# Altium schematic sheet WIFI_Sheet.SchDoc (part 1 of 3)
size 420 x 297 mm; SheetNumber: 1; SheetTotal: 2
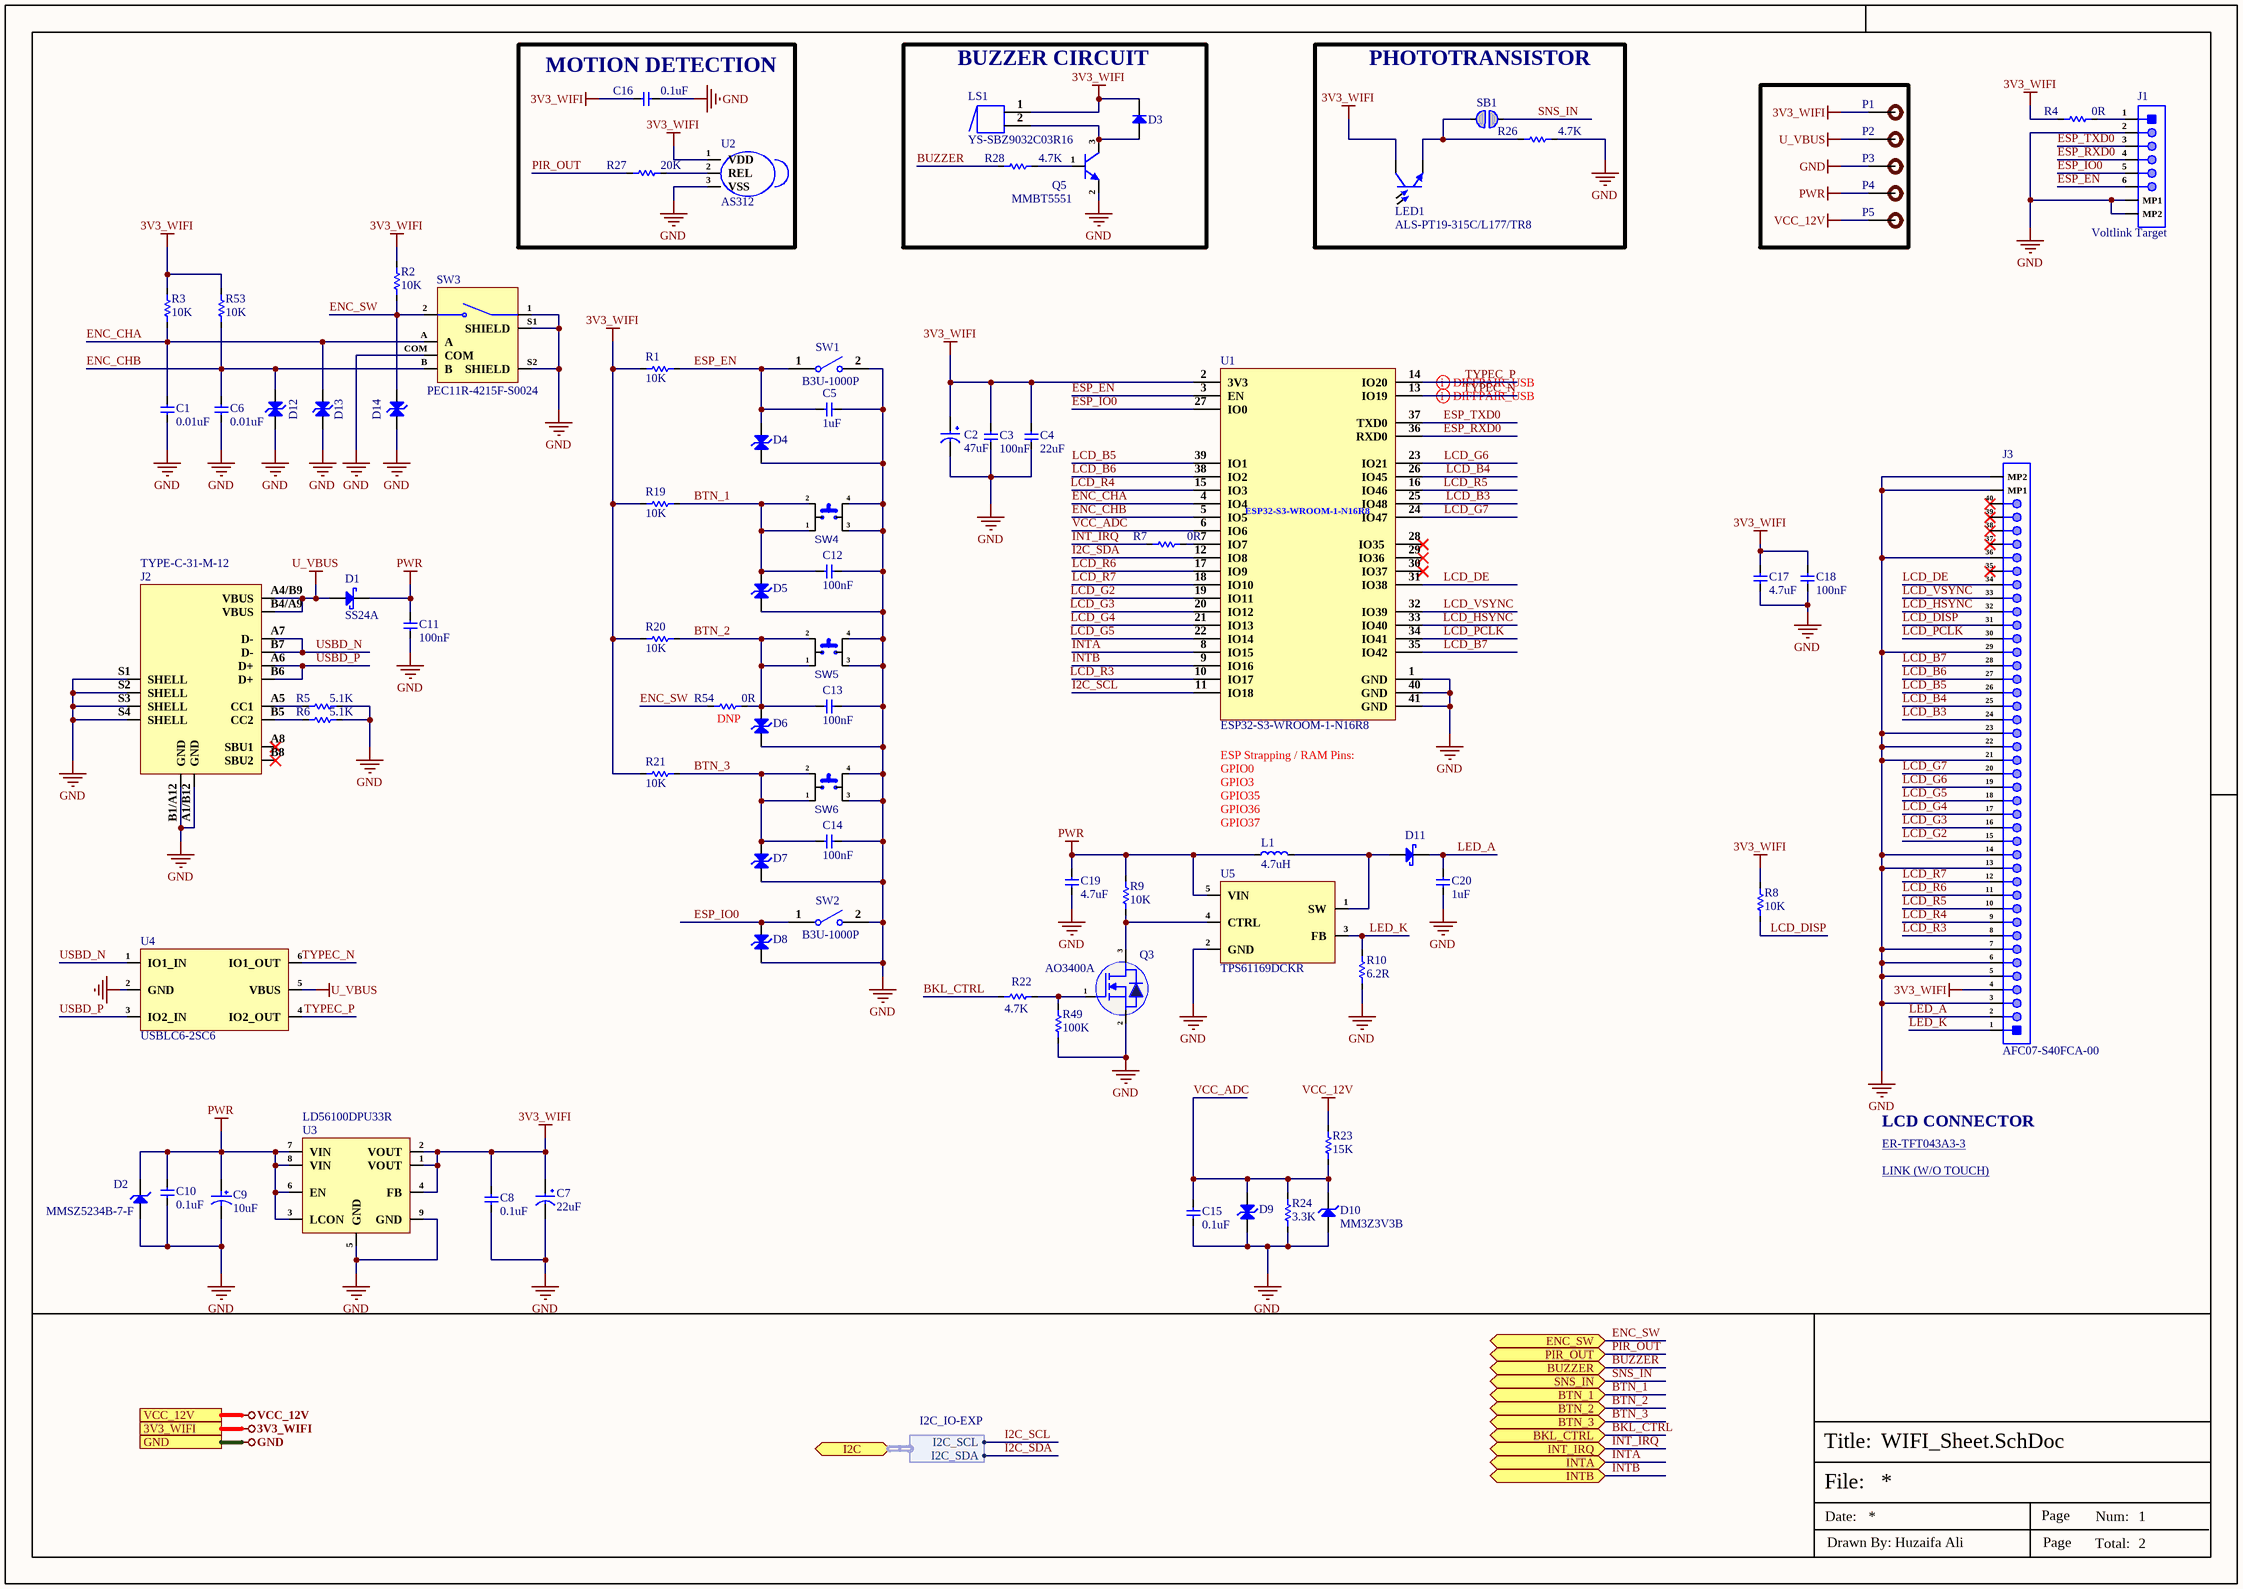
[diagram p0: WIFI_Sheet.SchDoc]

## Parts
C1  0.01uF  [Cap-0402]
C2  47uF  [Case-D]
C3  100nF  [Cap-0402]
C4  22uF  [Cap-0603]
C5  1uF  [Cap-0402]
C6  0.01uF  [Cap-0402]
C7  22uF  [Tant-0805]
C8  0.1uF  [Cap-0402]
C9  10uF  [Case-A]
C10  0.1uF  [Cap-0402]
C11  100nF  [Cap-0603]
C12  100nF  [Cap-0402]
C13  100nF  [Cap-0402]
C14  100nF  [Cap-0402]
C15  0.1uF  [Cap-0402]
C16  0.1uF  [Cap-0603]
C17  4.7uF  [Cap-0603]
C18  100nF  [Cap-0603]
C19  4.7uF  [Cap-0603]
C20  1uF  [Cap-0603]
D1  SS24A  [SMA]
D2  MMSZ5234B-7-F  [SOD-123]
D3  1N4148W-7-F  [SOD-123]  (value not drawn)
D4  LESD8D3.3CAT5G  [SOD-882 Bi Directional]  (value not drawn)
D5  LESD8D3.3CAT5G  [SOD-882 Bi Directional]  (value not drawn)
D6  LESD8D3.3CAT5G  [SOD-882 Bi Directional]  (value not drawn)
D7  LESD8D3.3CAT5G  [SOD-882 Bi Directional]  (value not drawn)
D8  LESD8D3.3CAT5G  [SOD-882 Bi Directional]  (value not drawn)
D9  LESD8D3.3CAT5G  [SOD-882 Bi Directional]  (value not drawn)
D10  MM3Z3V3B  [SOD323F]
D11  NSR0240HT1G  [SOD-323]  (value not drawn)
D12  LESD8D3.3CAT5G  [SOD-882 Bi Directional]  (value not drawn)
D13  LESD8D3.3CAT5G  [SOD-882 Bi Directional]  (value not drawn)
D14  LESD8D3.3CAT5G  [SOD-882 Bi Directional]  (value not drawn)
J1  Voltlink Target  [Voltlink Target]
J2  TYPE-C-31-M-12  [TYPE-C-31-M-12_]
J3  AFC07-S40FCA-00  [AFC07-S40FCA-00]
L1  4.7uH  [MWSA0402S-4R7MT]
LED1  ALS-PT19-315C/L177/TR8  [ALS-PT19-315C/L177/TR_]
LS1  YS-SBZ9032C03R16  [YS-SBZ9032C03R16_]
P1  TEST POINT 0.5mm Dia  [Test-point - 0.5mm]  (value not drawn)
P2  TEST POINT 0.5mm Dia  [Test-point - 0.5mm]  (value not drawn)
P3  TEST POINT 0.5mm Dia  [Test-point - 0.5mm]  (value not drawn)
P4  TEST POINT 0.5mm Dia  [Test-point - 0.5mm]  (value not drawn)
P5  TEST POINT 0.5mm Dia  [Test-point - 0.5mm]  (value not drawn)
Q3  AO3400A  [sot-23]
Q5  MMBT5551  [SOT-23]
R1  10K  [Res-0402]
R2  10K  [Res-0603]
R3  10K  [Res-0603]
R4  0R  [Res-0603]
R5  5.1K  [Res-0603]
R6  5.1K  [Res-0603]
R7  0R  [Res-0603]
R8  10K  [Res-0603]
R9  10K  [Res-0603]
R10  6.2R  [Res-1206]
R19  10K  [Res-0402]
R20  10K  [Res-0402]
R21  10K  [Res-0402]
R22  4.7K  [Res-0402]
R23  15K  [Res-0603]
R24  3.3K  [Res-0603]
R26  4.7K  [Res-0603]
R27  20K  [Res-0603]
R28  4.7K  [Res-0603]
R49  100K  [Res-0402]
R53  10K  [Res-0603]
R54  DNP  [Res-0603]
SB1  Solder Bridge 0603  [Solder Bridge]  (value not drawn)  (no BOM)
SW1  B3U-1000P  [B3U-1000P]
SW2  B3U-1000P  [B3U-1000P]
SW3  PEC11R-4215F-S0024  [PEC11R-4215F-S0024]
SW4  TL3300CF160Q  [TL3300CF160Q.]  (value not drawn)
SW5  TL3300CF160Q  [TL3300CF160Q.]  (value not drawn)
SW6  TL3300CF160Q  [TL3300CF160Q.]  (value not drawn)
U1  ESP32-S3-WROOM-1-N16R8  [41-SMD Module]
U2  AS312  [AS312]
U3  LD56100DPU33R  [DFN-8(1.2x1.6)]
U4  USBLC6-2SC6  [SOT-23-6]
U5  TPS61169DCKR  [SC70-5]

## Blocks framed on the sheet
MOTION DETECTION: C16 R27 U2
BUZZER CIRCUIT: D3 LS1 Q5 R28
PHOTOTRANSISTOR: LED1 R26 SB1

## Ports
3V3_WIFI (see IO_Expander_Sheet[1D]), BKL_CTRL (bidir, see IO_Expander_Sheet[4D]), BTN_1 (bidir, see IO_Expander_Sheet[4D]), BTN_2 (bidir, see IO_Expander_Sheet[4D]), BTN_3 (bidir, see IO_Expander_Sheet[4D]), BUZZER (bidir, see IO_Expander_Sheet[4D]), ENC_SW (bidir, see IO_Expander_Sheet[4D]), GND (see IO_Expander_Sheet[1D]), I2C (bidir, harness I2C_IO-EXP, see IO_Expander_Sheet[3D]), INT_IRQ (bidir, see IO_Expander_Sheet[4D]), INTA (bidir, see IO_Expander_Sheet[4D]), INTB (bidir, see IO_Expander_Sheet[4D]), PIR_OUT (bidir, see IO_Expander_Sheet[4D]), SNS_IN (bidir, see IO_Expander_Sheet[4D]), VCC_12V (see IO_Expander_Sheet[1D])

## Harnesses
I2C_IO-EXP: I2C_SCL, I2C_SDA

## Nets
3V3_WIFI: C2.1 C3.2 C4.2 C7.1 C8.2 C16.1 C17.2 C18.2 D3.2(K) J3.4 LED1.1(C) LS1.1 P1.1 R1.2 R2.1 R3.2 R4.1 R8.2 R19.2 R20.2 R21.2 R53.1 U1.2(3V3) U2.1(VDD) U3.1(VOUT) U3.2(VOUT) U3.4(FB) ; port 3V3_WIFI
GND: C1.1 C2.2 C3.1 C4.1 C5.1 C6.1 C7.2 C8.1 C9.2 C10.1 C11.1 C12.1 C13.1 C14.1 C15.1 C16.2 C17.1 C18.1 C19.1 C20.1 D2.1(A) D4.1(A) D5.1(A) D6.1(A) D7.1(A) D8.1(A) D9.1(A) D10.1(A) D12.1(A) D13.1(A) D14.1(A) J1.2 J1.MP1 J1.MP2 J2.A1/B12(GND) J2.B1/A12(GND) J2.S1(SHELL) J2.S2(SHELL) J2.S3(SHELL) J2.S4(SHELL) J3.3 J3.5 J3.6 J3.7 J3.13 J3.14 J3.21 J3.22 J3.23 J3.29 J3.36 J3.MP1 J3.MP2 P3.1 Q3.2(S) Q5.2(E) R5.2 R6.2 R10.1 R24.1 R26.2 R49.1 SW1.2 SW2.2 SW3.1 SW3.COM SW3.S1(SHIELD) SW3.S2(SHIELD) SW4.3 SW4.4 SW5.3 SW5.4 SW6.3 SW6.4 U1.1(GND) U1.40(GND) U1.41(GND) U2.3(VSS) U3.5(GND) U3.9(GND) U4.2(GND) U5.2(GND) ; port GND
PWR: C9.1 C10.2 C11.2 C19.2 D1.1(K) D2.2(K) L1.1 P4.1 R9.2 U3.3(LCON) U3.6(EN) U3.7(VIN) U3.8(VIN) U5.5(VIN)
U_VBUS: D1.2(A) J2.A4/B9(VBUS) J2.B4/A9(VBUS) P2.1 U4.5(VBUS)
VCC_12V: P5.1 R23.2 ; port VCC_12V
BKL_CTRL: R22.2 ; port BKL_CTRL
BTN_1: C12.2 D5.2(A) R19.1 SW4.1 SW4.2 ; port BTN_1
BTN_2: C13.2 D6.2(A) R20.1 R54.2 SW5.1 SW5.2 ; port BTN_2
BTN_3: C14.2 D7.2(A) R21.1 SW6.1 SW6.2 ; port BTN_3
BUZZER: R28.1 ; port BUZZER
ENC_CHA: C1.2 D13.2(A) R3.1 SW3.A U1.4(IO4)
ENC_CHB: C6.2 D12.2(A) R53.2 SW3.B U1.5(IO5)
ENC_SW: D14.2(A) R2.2 R54.1 SW3.2 ; port ENC_SW
ESP_EN: C5.2 D4.2(A) J1.6 R1.1 SW1.1 U1.3(EN)
ESP_IO0: D8.2(A) J1.5 SW2.1 U1.27(IO0)
ESP_RXD0: J1.4 U1.36(RXD0)
ESP_TXD0: J1.3 U1.37(TXD0)
I2C_SCL: U1.11(IO18) ; port I2C.I2C_SCL
I2C_SDA: U1.12(IO8) ; port I2C.I2C_SDA
INT_IRQ: R7.1 ; port INT_IRQ
INTA: U1.8(IO15) ; port INTA
INTB: U1.9(IO16) ; port INTB
LCD_B3: J3.24 U1.25(IO48)
LCD_B4: J3.25 U1.26(IO45)
LCD_B5: J3.26 U1.39(IO1)
LCD_B6: J3.27 U1.38(IO2)
LCD_B7: J3.28 U1.35(IO42)
LCD_DE: J3.34 U1.31(IO38)
LCD_DISP: J3.31 R8.1
LCD_G2: J3.15 U1.19(IO11)
LCD_G3: J3.16 U1.20(IO12)
LCD_G4: J3.17 U1.21(IO13)
LCD_G5: J3.18 U1.22(IO14)
LCD_G6: J3.19 U1.23(IO21)
LCD_G7: J3.20 U1.24(IO47)
LCD_HSYNC: J3.32 U1.33(IO40)
LCD_PCLK: J3.30 U1.34(IO41)
LCD_R3: J3.8 U1.10(IO17)
LCD_R4: J3.9 U1.15(IO3)
LCD_R5: J3.10 U1.16(IO46)
LCD_R6: J3.11 U1.17(IO9)
LCD_R7: J3.12 U1.18(IO10)
LCD_VSYNC: J3.33 U1.32(IO39)
LED_A: C20.2 D11.1(K) J3.2
LED_K: J3.1 R10.2 U5.3(FB)
PIR_OUT: R27.1 ; port PIR_OUT
SNS_IN: SB1.1 ; port SNS_IN
TYPEC_N: U1.13(IO19) U4.6(IO1_OUT)
TYPEC_P: U1.14(IO20) U4.4(IO2_OUT)
USBD_N: J2.A7(D-) J2.B7(D-) U4.1(IO1_IN)
USBD_P: J2.A6(D+) J2.B6(D+) U4.3(IO2_IN)
VCC_ADC: C15.2 D9.2(A) D10.2(K) R23.1 R24.2 U1.6(IO6)
NetD3_1: D3.1(A) LS1.2 Q5.3(C)
NetD11_2: D11.2(A) L1.2 U5.1(SW)
NetJ1_1: J1.1 R4.2
NetJ2_A5: J2.A5(CC1) R5.1
NetJ2_B5: J2.B5(CC2) R6.1
NetLED1_2: LED1.2(E) R26.1 SB1.2
NetQ3_1: Q3.1(G) R22.1 R49.2
NetQ3_3: Q3.3(D) R9.1 U5.4(CTRL)
NetQ5_1: Q5.1(B) R28.2
NetR7_2: R7.2 U1.7(IO7)
NetR27_2: R27.2 U2.2(REL)

Not connected (* = marked no-connect by the designer): J2 A8(SBU1)* B8(SBU2)*; J3 35* 37* 38* 39* 40*; U1 28(IO35_)* 29(IO36_)* 30(IO37)*

## Layout directives
differential pair; net class USB_PROG; differential pair class USB_PROG_LINES: TYPEC_N, TYPEC_P

## Notes on the sheet
- (near R54) 0R
- (near L1) ESP Strapping / RAM Pins:
  GPIO0
  GPIO3
  GPIO35
  GPIO36
  GPIO37
- LCD CONNECTOR
- ER-TFT043A3-3 <https://www.buydisplay.com/download/manual/ER-TFT043A3-3_Datasheet.pdf?srsltid=AfmBOor6KHCqtX4iRDfnE8aEj7G3wne46MVZczR5BwYJhRQqSwwBunfz>
- LINK (W/O TOUCH) <https://www.buydisplay.com/sunlight-readable-4-3-inch-high-brightness-480x272-tft-lcd-display?srsltid=AfmBOor6YnfEeTkSpbEntf25o5PHS14cteiEDXzHWxqpG4RG_-Yj2mqI>
- File:
- Title:
- Date:
- Page
- Num:
- Total:
- Drawn By: Huzaifa Ali